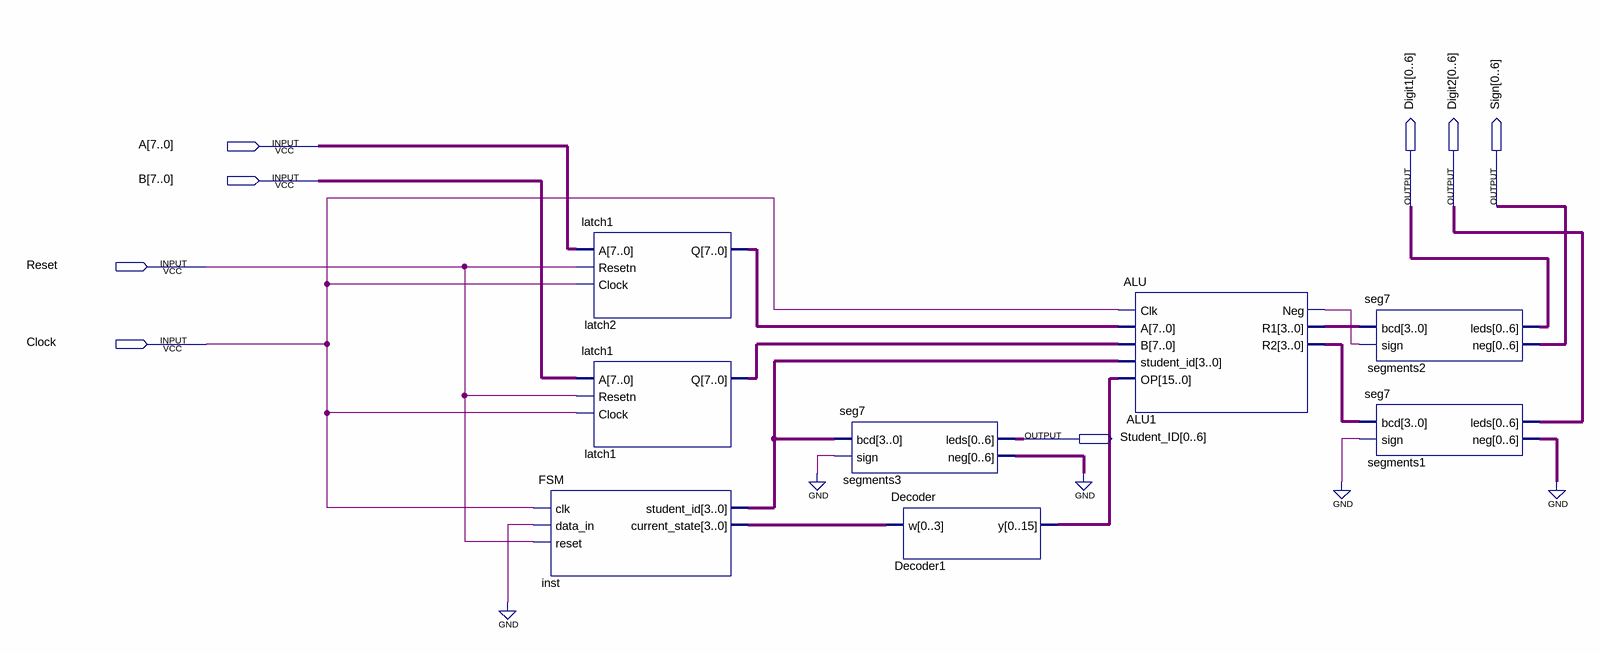
[diagram p0: schematic sheet]
// Quartus schematic Lab6.bdf as structural Verilog: 8 symbols, 8 pins
module Lab6 (
  input  [7:0] A,
  input  [7:0] B,
  input  Reset,
  input  Clock,
  output [0:6] Digit1,
  output [0:6] Digit2,
  output [0:6] Sign,
  output [0:6] Student_ID
);

  wire ALU1_neg;
  wire [3:0] ALU1_r1, ALU1_r2, inst_current_state, inst_student_id;
  wire [6:0] segments1_neg, segments3_neg;
  wire [7:0] latch1_q, latch2_q;
  wire [15:0] Decoder1_y;

  FSM inst (
    .clk(Clock), .data_in(1'b0), .reset(Reset), .student_id(inst_student_id),
    .current_state(inst_current_state));
  latch1 latch2 (.A(A), .Resetn(Reset), .Clock(Clock), .Q(latch2_q));
  latch1 latch1 (.A(B), .Resetn(Reset), .Clock(Clock), .Q(latch1_q));
  seg7 segments3 (.bcd(inst_student_id), .sign(1'b0), .leds(Student_ID), .neg(segments3_neg));
  Decoder Decoder1 (.w(inst_current_state), .y(Decoder1_y));
  ALU ALU1 (
    .Clk(Clock), .A(latch2_q), .B(latch1_q), .student_id(inst_student_id), .OP(Decoder1_y), .Neg(ALU1_neg),
    .R1(ALU1_r1), .R2(ALU1_r2));
  seg7 segments2 (.bcd(ALU1_r1), .sign(ALU1_neg), .leds(Digit1), .neg(Sign));
  seg7 segments1 (.bcd(ALU1_r2), .sign(1'b0), .leds(Digit2), .neg(segments1_neg));
  // also tied to GND on the sheet: {segments1_neg[0], segments1_neg[1], segments1_neg[2], segments1_neg[3], segments1_neg[4], segments1_neg[5], segments1_neg[6], segments3_neg[0], segments3_neg[1], segments3_neg[2], segments3_neg[3], segments3_neg[4], segments3_neg[5], segments3_neg[6]}
endmodule
